# Altium schematic sheet ADC.SchDoc: ADS127L14 ADC assembly
size A4; DocumentNumber: ADC-SCH-03; SheetNumber: 3; SheetTotal: 20
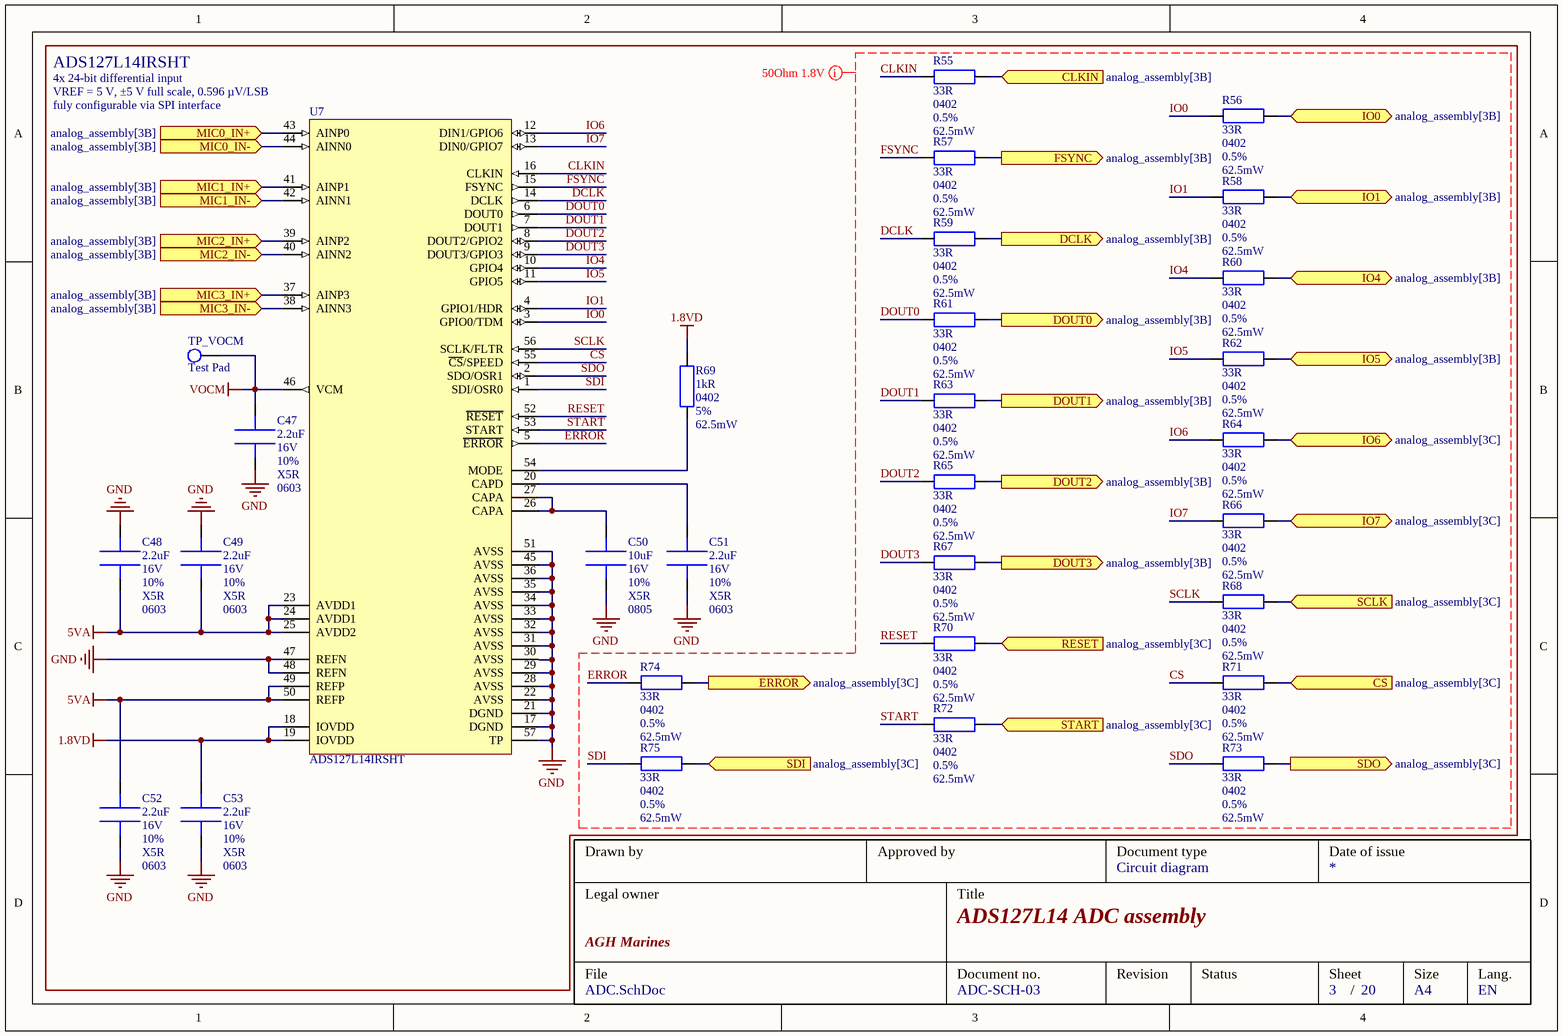
[diagram p0: ADC.SchDoc]

## Parts
C47  value 2.2uF  Voltage: 16V  Tolerance: 10%  Dielectric: X5R  Package: 0603  [CAPC_0603]  (hidden comment: C0603C225K4PAC)
C48  value 2.2uF  Voltage: 16V  Tolerance: 10%  Dielectric: X5R  Package: 0603  [CAPC_0603]  (hidden comment: C0603C225K4PAC)
C49  value 2.2uF  Voltage: 16V  Tolerance: 10%  Dielectric: X5R  Package: 0603  [CAPC_0603]  (hidden comment: C0603C225K4PAC)
C50  value 10uF  Voltage: 16V  Tolerance: 10%  Dielectric: X5R  Package: 0805  [CAPC_0805]  (hidden comment: EMK212BJ106KG-T)
C51  value 2.2uF  Voltage: 16V  Tolerance: 10%  Dielectric: X5R  Package: 0603  [CAPC_0603]  (hidden comment: C0603C225K4PAC)
C52  value 2.2uF  Voltage: 16V  Tolerance: 10%  Dielectric: X5R  Package: 0603  [CAPC_0603]  (hidden comment: C0603C225K4PAC)
C53  value 2.2uF  Voltage: 16V  Tolerance: 10%  Dielectric: X5R  Package: 0603  [CAPC_0603]  (hidden comment: C0603C225K4PAC)
R55  value 33R  Package: 0402  Tolerance: 0.5%  Power: 62.5mW  [RESC_0402]  (hidden comment: RG1005R-330-D-T10)
R56  value 33R  Package: 0402  Tolerance: 0.5%  Power: 62.5mW  [RESC_0402]  (hidden comment: RG1005R-330-D-T10)
R57  value 33R  Package: 0402  Tolerance: 0.5%  Power: 62.5mW  [RESC_0402]  (hidden comment: RG1005R-330-D-T10)
R58  value 33R  Package: 0402  Tolerance: 0.5%  Power: 62.5mW  [RESC_0402]  (hidden comment: RG1005R-330-D-T10)
R59  value 33R  Package: 0402  Tolerance: 0.5%  Power: 62.5mW  [RESC_0402]  (hidden comment: RG1005R-330-D-T10)
R60  value 33R  Package: 0402  Tolerance: 0.5%  Power: 62.5mW  [RESC_0402]  (hidden comment: RG1005R-330-D-T10)
R61  value 33R  Package: 0402  Tolerance: 0.5%  Power: 62.5mW  [RESC_0402]  (hidden comment: RG1005R-330-D-T10)
R62  value 33R  Package: 0402  Tolerance: 0.5%  Power: 62.5mW  [RESC_0402]  (hidden comment: RG1005R-330-D-T10)
R63  value 33R  Package: 0402  Tolerance: 0.5%  Power: 62.5mW  [RESC_0402]  (hidden comment: RG1005R-330-D-T10)
R64  value 33R  Package: 0402  Tolerance: 0.5%  Power: 62.5mW  [RESC_0402]  (hidden comment: RG1005R-330-D-T10)
R65  value 33R  Package: 0402  Tolerance: 0.5%  Power: 62.5mW  [RESC_0402]  (hidden comment: RG1005R-330-D-T10)
R66  value 33R  Package: 0402  Tolerance: 0.5%  Power: 62.5mW  [RESC_0402]  (hidden comment: RG1005R-330-D-T10)
R67  value 33R  Package: 0402  Tolerance: 0.5%  Power: 62.5mW  [RESC_0402]  (hidden comment: RG1005R-330-D-T10)
R68  value 33R  Package: 0402  Tolerance: 0.5%  Power: 62.5mW  [RESC_0402]  (hidden comment: RG1005R-330-D-T10)
R69  value 1kR  Package: 0402  Tolerance: 5%  Power: 62.5mW  [RESC_0402]  (hidden comment: RC0402JR-7D1KL)
R70  value 33R  Package: 0402  Tolerance: 0.5%  Power: 62.5mW  [RESC_0402]  (hidden comment: RG1005R-330-D-T10)
R71  value 33R  Package: 0402  Tolerance: 0.5%  Power: 62.5mW  [RESC_0402]  (hidden comment: RG1005R-330-D-T10)
R72  value 33R  Package: 0402  Tolerance: 0.5%  Power: 62.5mW  [RESC_0402]  (hidden comment: RG1005R-330-D-T10)
R73  value 33R  Package: 0402  Tolerance: 0.5%  Power: 62.5mW  [RESC_0402]  (hidden comment: RG1005R-330-D-T10)
R74  value 33R  Package: 0402  Tolerance: 0.5%  Power: 62.5mW  [RESC_0402]  (hidden comment: RG1005R-330-D-T10)
R75  value 33R  Package: 0402  Tolerance: 0.5%  Power: 62.5mW  [RESC_0402]  (hidden comment: RG1005R-330-D-T10)
TP_VOCM  Test Pad  [TP_1.4mm]
U7  ADS127L14IRSHT  [IC_VQFN56]

## Ports
CLKIN (in, see analog_assembly[3B]), CS (in, see analog_assembly[3C]), DCLK (out, see analog_assembly[3B]), DOUT0 (out, see analog_assembly[3B]), DOUT1 (out, see analog_assembly[3B]), DOUT2 (out, see analog_assembly[3B]), DOUT3 (out, see analog_assembly[3B]), ERROR (out, see analog_assembly[3C]), FSYNC (out, see analog_assembly[3B]), IO0 (bidir, see analog_assembly[3B]), IO1 (bidir, see analog_assembly[3B]), IO4 (bidir, see analog_assembly[3B]), IO5 (bidir, see analog_assembly[3B]), IO6 (bidir, see analog_assembly[3C]), IO7 (bidir, see analog_assembly[3C]), MIC0_IN+ (in, see analog_assembly[3B]), MIC0_IN- (in, see analog_assembly[3B]), MIC1_IN+ (in, see analog_assembly[3B]), MIC1_IN- (in, see analog_assembly[3B]), MIC2_IN+ (in, see analog_assembly[3B]), MIC2_IN- (in, see analog_assembly[3B]), MIC3_IN+ (in, see analog_assembly[3B]), MIC3_IN- (in, see analog_assembly[3B]), RESET (in, see analog_assembly[3C]), SCLK (in, see analog_assembly[3C]), SDI (in, see analog_assembly[3C]), SDO (out, see analog_assembly[3C]), START (in, see analog_assembly[3C])

## Nets
1.8VD: C53.1 R69.2 U7.18(IOVDD) U7.19(IOVDD)
5VA: C48.2 C49.2 C52.1 U7.23(AVDD1) U7.24(AVDD1) U7.25(AVDD2) U7.49(REFP) U7.50(REFP)
GND: C47.2 C48.1 C49.1 C50.2 C51.2 C52.2 C53.2 U7.17(DGND) U7.21(DGND) U7.22(AVSS) U7.28(AVSS) U7.29(AVSS) U7.31(AVSS) U7.32(AVSS) U7.33(AVSS) U7.34(AVSS) U7.35(AVSS) U7.36(AVSS) U7.45(AVSS) U7.47(REFN) U7.48(REFN) U7.51(AVSS) U7.57(TP)
VOCM: C47.1 TP_VOCM.1 U7.46(VCM)
CLKIN: R55.2 U7.16(CLKIN)
CLKIN: R55.1 ; port CLKIN  [a separate net that carries the same name]
CS: R71.2 U7.55(~{CS}/SPEED)
CS: R71.1 ; port CS  [a separate net that carries the same name]
DCLK: R59.2 U7.14(DCLK)
DCLK: R59.1 ; port DCLK  [a separate net that carries the same name]
DOUT0: R61.2 U7.6(DOUT0)
DOUT0: R61.1 ; port DOUT0  [a separate net that carries the same name]
DOUT1: R63.2 U7.7(DOUT1)
DOUT1: R63.1 ; port DOUT1  [a separate net that carries the same name]
DOUT2: R65.2 U7.8(DOUT2/GPIO2)
DOUT2: R65.1 ; port DOUT2  [a separate net that carries the same name]
DOUT3: R67.2 U7.9(DOUT3/GPIO3)
DOUT3: R67.1 ; port DOUT3  [a separate net that carries the same name]
ERROR: R74.2 U7.5(~{ERROR})
ERROR: R74.1 ; port ERROR  [a separate net that carries the same name]
FSYNC: R57.2 U7.15(FSYNC)
FSYNC: R57.1 ; port FSYNC  [a separate net that carries the same name]
IO0: R56.2 U7.3(GPIO0/TDM)
IO0: R56.1 ; port IO0  [a separate net that carries the same name]
IO1: R58.2 U7.4(GPIO1/HDR)
IO1: R58.1 ; port IO1  [a separate net that carries the same name]
IO4: R60.2 U7.10(GPIO4)
IO4: R60.1 ; port IO4  [a separate net that carries the same name]
IO5: R62.2 U7.11(GPIO5)
IO5: R62.1 ; port IO5  [a separate net that carries the same name]
IO6: R64.2 U7.12(DIN1/GPIO6)
IO6: R64.1 ; port IO6  [a separate net that carries the same name]
IO7: R66.2 U7.13(DIN0/GPIO7)
IO7: R66.1 ; port IO7  [a separate net that carries the same name]
MIC0_IN+: U7.43(AINP0) ; port MIC0_IN+
MIC0_IN-: U7.44(AINN0) ; port MIC0_IN-
MIC1_IN+: U7.41(AINP1) ; port MIC1_IN+
MIC1_IN-: U7.42(AINN1) ; port MIC1_IN-
MIC2_IN+: U7.39(AINP2) ; port MIC2_IN+
MIC2_IN-: U7.40(AINN2) ; port MIC2_IN-
MIC3_IN+: U7.37(AINP3) ; port MIC3_IN+
MIC3_IN-: U7.38(AINN3) ; port MIC3_IN-
RESET: R70.2 U7.52(~{RESET})
RESET: R70.1 ; port RESET  [a separate net that carries the same name]
SCLK: R68.2 U7.56(SCLK/FLTR)
SCLK: R68.1 ; port SCLK  [a separate net that carries the same name]
SDI: R75.2 U7.1(SDI/OSR0)
SDI: R75.1 ; port SDI  [a separate net that carries the same name]
SDO: R73.2 U7.2(SDO/OSR1)
SDO: R73.1 ; port SDO  [a separate net that carries the same name]
START: R72.2 U7.53(START)
START: R72.1 ; port START  [a separate net that carries the same name]
NetC50_1: C50.1 U7.26(CAPA) U7.27(CAPA)
NetC51_1: C51.1 U7.20(CAPD)
NetR69_1: R69.1 U7.54(MODE)

Not connected (* = marked no-connect by the designer): U7 30(AVSS)

## Layout directives
net class 50OhmSingle: CLKIN, CS, DCLK, DOUT0, DOUT1, DOUT2, DOUT3, ERROR, FSYNC, IO0, IO1, IO4, IO5, IO6, IO7, RESET, SCLK, SDI, SDO, START

## Notes on the sheet
- ADS127L14IRSHT
- 4x 24-bit differential input
- (near U7) VREF = 5 V, ±5 V full scale, 0.596 µV/LSB
- (near U7) fuly configurable via SPI interface
- Drawn by
- Approved by
- Document type
- Date of issue
- Legal owner
- Title
- Circuit diagram
- File
- AGH Marines
- Document no.
- Revision
- Status
- Sheet
- Size
- Lang.
- /
- A4
- EN

## Library data of the parts
C47-C49 C51-C53 = C0603C225K4PAC: Multilayer Ceramic Capacitors MLCC - SMD/SMT 16V 2.2uF X5R 0603 10%; Manufacturer: KEMET; Supplier 1: Mouser; Supplier Part Number 1: 80-C0603C225K4PAC
C50 = EMK212BJ106KG-T: Multilayer Ceramic Capacitors MLCC - SMD/SMT 16V 10uF X5R 0805 10 %; Manufacturer: TAIYO YUDEN; Supplier 1: Mouser; Supplier Part Number 1: 963-EMK212BJ106KG-T
R55-R68 R70-R75 = RG1005R-330-D-T10: Thin Film Resistors - SMD 1/16W 33 Ohms 0.5% 0402 100ppm; Manufacturer: Susumu; Supplier 1: Mouser; Supplier Part Number 1: 754-RG1005R-330DT10
R69 = RC0402JR-7D1KL: Thick Film Resistors - SMD General Purpose Chip Resistor 0402, 1kOhms, 5%, 1/16W; Manufacturer: YAGEO; Supplier 1: Mouser; Supplier Part Number 1: 603-RC0402JR-7D1KL
U7 = ADS127L14IRSHT: Analog to Digital Converters - ADC; Manufacturer: Texas Instruments; Package: VQFN-56; Supplier 1: Mouser; Supplier Part Number 1: 595-ADS127L14IRSHT